# Altium schematic sheet CON_PCIe_X4.SchDoc
size 297 x 209 mm
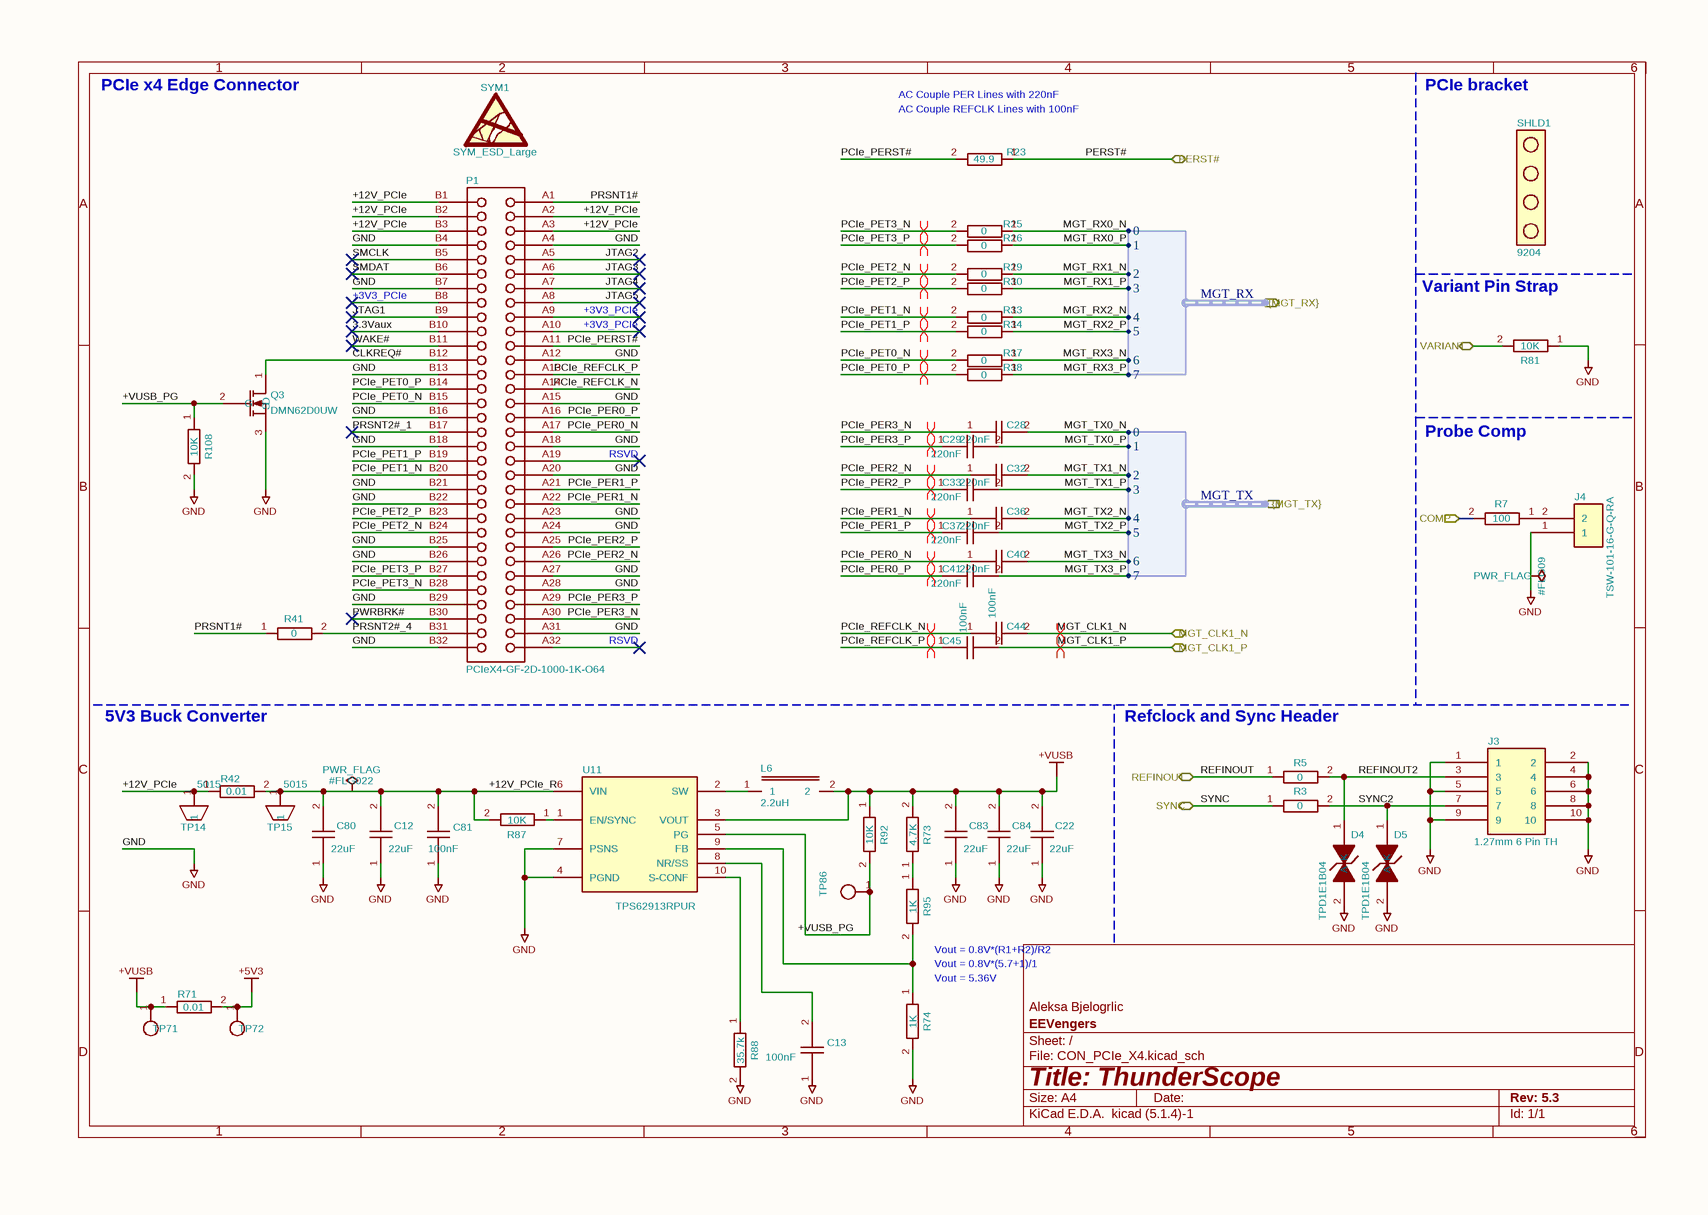
[diagram p0: CON_PCIe_X4.SchDoc]

## Parts
#FLG09  PWR_FLAG  (graphical)
#FLG022  PWR_FLAG  (graphical)
C12  22uF  [GEN_C_0805]
C13  100nF  [GEN_C_0402]
C22  22uF  [GEN_C_0805]
C28  220nF  [GEN_C_0402]
C29  220nF  [GEN_C_0402]
C32  220nF  [GEN_C_0402]
C33  220nF  [GEN_C_0402]
C36  220nF  [GEN_C_0402]
C37  220nF  [GEN_C_0402]
C40  220nF  [GEN_C_0402]
C41  220nF  [GEN_C_0402]
C44  100nF  [GEN_C_0402]
C45  100nF  [GEN_C_0402]
C80  22uF  [GEN_C_0805]
C81  100nF  [GEN_C_0402]
C83  22uF  [GEN_C_0805]
C84  22uF  [GEN_C_0805]
D4  TPD1E1B04  [TI_X1SON_DPY0002A]
D5  TPD1E1B04  [TI_X1SON_DPY0002A]
J3  1.27mm 6 Pin TH  [GEN_1.27mm_2x5_Pin_TH_RA]
J4  TSW-101-16-G-Q-RA  [GEN_5.08mm_1x2_Pin_TH_RA]
L6  2.2uH  [GEN_L_1210]
P1  PCIeX4-GF-2D-1000-1K-O64  [PCIeX4-GF-2D-1000-1K-O64]
Q3  DMN62D0UW  [GEN_SOT_323]
R3  0  [GEN_R_0402]
R5  0  [GEN_R_0402]
R7  100  [GEN_R_0402]
R23  49.9  [GEN_R_0402]
R25  0  [GEN_R_0402]
R26  0  [GEN_R_0402]
R29  0  [GEN_R_0402]
R30  0  [GEN_R_0402]
R33  0  [GEN_R_0402]
R34  0  [GEN_R_0402]
R37  0  [GEN_R_0402]
R38  0  [GEN_R_0402]
R41  0  [GEN_R_0402]
R42  0.01  [GEN_R_0603]
R71  0.01  [GEN_R_0603]
R73  4.7K  [GEN_R_0402]
R74  1K  [GEN_R_0402]
R81  10K  [GEN_R_0402]
R87  10K  [GEN_R_0402]
R88  35.7k  [GEN_R_0402]
R92  10K  [GEN_R_0402]
R95  1K  [GEN_R_0402]
R108  10K  [GEN_R_0402]
SHLD1  9204  (mechanical)
SYM1  SYM_ESD_Large  [ESD-Logo_6.6x6mm_SilkScreen]
TP14  5015  [KEY_5015]
TP15  5015  [KEY_5015]
TP71  PCB  [GEN_TP_PCB]  (value not drawn)
TP72  PCB  [GEN_TP_PCB]  (value not drawn)
TP86  PCB  [GEN_TP_PCB]  (value not drawn)
U11  value TPS62913RPUR  [TPS62913RPUR]  (hidden comment: TPS62913)

## Ports
COMP (in), MGT_CLK1_N (bidir), MGT_CLK1_P (bidir), PERST# (bidir), REFINOUT (bidir), SYNC (bidir), VARIANT (bidir), {MGT_RX} (out, harness MGT_RX), {MGT_TX} (in, harness MGT_TX)

## Harnesses
MGT_RX: 0, 1, 2, 3, 4, 5, 6, 7
MGT_TX: 0, 1, 2, 3, 4, 5, 6, 7

## Nets
+5V3: R71.2 TP72.1
+VUSB: C22.2 C83.2 C84.2 L6.2 R71.1 R73.2 R92.1 TP71.1 U11.3(VOUT)
GND: #FLG09.1 C12.1 C13.1 C22.1 C80.1 C81.1 C83.1 C84.1 D4.2(A) D5.2(A) J3.1 J3.2 J3.4 J3.5 J3.6 J3.8 J3.9 J3.10 J4.1 P1.A4 P1.A12 P1.A15 P1.A18 P1.A20 P1.A23 P1.A24 P1.A27 P1.A28 P1.A31 P1.B4 P1.B7 P1.B13 P1.B16 P1.B18 P1.B21 P1.B22 P1.B25 P1.B26 P1.B29 P1.B32 Q3.3(S) R74.2 R81.1 R88.2 R108.2 U11.4(PGND) U11.7(PSNS)
3.3Vaux: P1.B10
+12V_PCIe: P1.A2 P1.A3 P1.B1 P1.B2 P1.B3 R42.1 TP14.1
+12V_PCIe_R: #FLG022.1 C12.2 C80.2 C81.2 R42.2 R87.2 TP15.1 U11.6(VIN)
+VUSB_PG: Q3.2(G) R92.2 R108.1 TP86.1 U11.5(PG)
CLKREQ#: P1.B12 Q3.1(D)
COMP: R7.2 ; port COMP
JTAG1: P1.B9
JTAG2: P1.A5
JTAG3: P1.A6
JTAG4: P1.A7
JTAG5: P1.A8
MGT_CLK1_N: C44.2 ; port MGT_CLK1_N
MGT_CLK1_P: C45.2 ; port MGT_CLK1_P
MGT_RX0_N: R25.1 ; port {MGT_RX}.0
MGT_RX0_P: R26.1 ; port {MGT_RX}.1
MGT_RX1_N: R29.1 ; port {MGT_RX}.2
MGT_RX1_P: R30.1 ; port {MGT_RX}.3
MGT_RX2_N: R33.1 ; port {MGT_RX}.4
MGT_RX2_P: R34.1 ; port {MGT_RX}.5
MGT_RX3_N: R37.1 ; port {MGT_RX}.6
MGT_RX3_P: R38.1 ; port {MGT_RX}.7
MGT_TX0_N: C28.2 ; port {MGT_TX}.0
MGT_TX0_P: C29.2 ; port {MGT_TX}.1
MGT_TX1_N: C32.2 ; port {MGT_TX}.2
MGT_TX1_P: C33.2 ; port {MGT_TX}.3
MGT_TX2_N: C36.2 ; port {MGT_TX}.4
MGT_TX2_P: C37.2 ; port {MGT_TX}.5
MGT_TX3_N: C40.2 ; port {MGT_TX}.6
MGT_TX3_P: C41.2 ; port {MGT_TX}.7
PCIe_PER0_N: C40.1 P1.A17
PCIe_PER0_P: C41.1 P1.A16
PCIe_PER1_N: C36.1 P1.A22
PCIe_PER1_P: C37.1 P1.A21
PCIe_PER2_N: C32.1 P1.A26
PCIe_PER2_P: C33.1 P1.A25
PCIe_PER3_N: C28.1 P1.A30
PCIe_PER3_P: C29.1 P1.A29
PCIe_PERST#: P1.A11 R23.2
PCIe_PET0_N: P1.B15 R37.2
PCIe_PET0_P: P1.B14 R38.2
PCIe_PET1_N: P1.B20 R33.2
PCIe_PET1_P: P1.B19 R34.2
PCIe_PET2_N: P1.B24 R29.2
PCIe_PET2_P: P1.B23 R30.2
PCIe_PET3_N: P1.B28 R25.2
PCIe_PET3_P: P1.B27 R26.2
PCIe_REFCLK_N: C44.1 P1.A14
PCIe_REFCLK_P: C45.1 P1.A13
PERST#: R23.1 ; port PERST#
PRSNT1#: P1.A1 R41.1
PRSNT2#_1: P1.B17
PRSNT2#_4: P1.B31 R41.2
PWRBRK#: P1.B30
REFINOUT: R5.1 ; port REFINOUT
REFINOUT2: D4.1(K) J3.3 R5.2
SMCLK: P1.B5
SMDAT: P1.B6
SYNC: R3.1 ; port SYNC
SYNC2: D5.1(K) J3.7 R3.2
VARIANT: R81.2 ; port VARIANT
WAKE#: P1.B11
NetC13_2: C13.2 U11.8(NR/SS)
NetJ4_2: J4.2 R7.1
NetL6_1: L6.1 U11.2(SW)
NetR73_1: R73.1 R95.1
NetR74_1: R74.1 R95.2 U11.9(FB)
NetR87_1: R87.1 U11.1(EN/SYNC)
NetR88_1: R88.1 U11.10(S-CONF)

Not connected (* = marked no-connect by the designer): P1 A9* A10* A19* A32* B8*

## Layout directives
differential pair; differential pair class PCIe: PCIe_PER0_N, PCIe_PER0_P, PCIe_PER1_N, PCIe_PER1_P, PCIe_PER2_N, PCIe_PER2_P, PCIe_PER3_N, PCIe_PER3_P, PCIe_PET0_N, PCIe_PET0_P, PCIe_PET1_N, PCIe_PET1_P, PCIe_PET2_N, PCIe_PET2_P, PCIe_PET3_N, PCIe_PET3_P, PCIe_REFCLK_N, PCIe_REFCLK_P
differential pair: MGT_CLK1_N, MGT_CLK1_P

## Notes on the sheet
- PCIe x4 Edge Connector
- AC Couple PER Lines with 220nF
- (near R23) AC Couple REFCLK Lines with 100nF
- PCIe bracket
- +3V3_PCIe
- (near R81) Variant Pin Strap
- RSVD
- Probe Comp
- 5V3 Buck Converter
- Refclock and Sync Header
- Vout = 0.8V*(5.7+1)/1
- (near R95) Vout = 0.8V*(R1+R2)/R2
- (near R74) Vout = 5.36V
- 1
- 2
- 3
- 4
- 5
- 6
- A
- B
- C
- Aleksa Bjelogrlic
- D
- Title: ThunderScope
- File: CON_PCIe_X4.kicad_sch
- Sheet: /
- EEVengers
- KiCad E.D.A.  kicad (5.1.4)-1
- Size: A4
- Date:
- Rev: 5.3
- Id: 1/1

## Library data of the parts
C12 C22 C80 C83 C84 = CAP 22uF 25V X5R 0805: HOUSE PART NUMBER: C-22uF-0805-002; MANUFACTURER: Murata; MANUFACTURER PART NUMBER: GRM21BR61E226ME44L; VOLTAGE RATING: 25V; Substitutions Policy: Any Parametric Equivalent; PACKAGE: 0805; SUPPLIER 1: Mouser; SUPPLIER PART NUMBER 1: 81-GRM21BR61E226ME4L; Footprint: Thunderscope_Rev5:GEN_C_0805; Value: 22uF
C13 C44 C45 C81 = CAP 100nF 16V X7R 0402: HOUSE PART NUMBER: C-100nF-0402-002; MANUFACTURER: Murata; MANUFACTURER PART NUMBER: GCM155R71C104KA55D; VOLTAGE RATING: 16V; Substitutions Policy: Any Parametric Equivalent; PACKAGE: 0402; SUPPLIER 1: Mouser; SUPPLIER PART NUMBER 1: 81-GCM155R71C104KA5D; Footprint: Thunderscope_Rev5:GEN_C_0402; Value: 100nF
C28 C29 C32 C33 C36 C37 C40 C41 = CAP 220nF 16V X7R 0402: HOUSE PART NUMBER: C-100nF-0402-002; MANUFACTURER: Murata; MANUFACTURER PART NUMBER: GCM155R71C224KE02D; VOLTAGE RATING: 16V; Substitutions Policy: Any Parametric Equivalent; PACKAGE: 0402; SUPPLIER 1: Mouser; SUPPLIER PART NUMBER 1: 81-GCM155R71C224KE2D; Footprint: Thunderscope_Rev5:GEN_C_0402; Value: 220nF
D4 D5 = TVS TPD1E1B04: MANUFACTURER: Texas Instruments; MANUFACTURER PART NUMBER: TPD1E1B04DPYR; Substitutions Policy: No Substitutions; SUPPLIER 1: Texas Instruments; SUPPLIER PART NUMBER 1: TPD1E1B04DPYR; PACKAGE: 2-X1SON (1x0.6mm); Footprint: Thunderscope_Rev5:TI_X1SON_DPY0002A; Value: TPD1E1B04
J3 = CONN 1.27mm 2x5 Pin TH RA: MANUFACTURER: CNC Tech; MANUFACTURER PART NUMBER: 3220-10-0200-00; Substitutions Policy: ECO Required for Substitution; SUPPLIER 1: Digi-Key; SUPPLIER PART NUMBER 1: 1175-1628-ND; PACKAGE: Through Hole; Footprint: Thunderscope_Rev5:GEN_1.27mm_2x5_Pin_TH_RA; Value: 1.27mm 6 Pin TH
J4 = CONN 5.08mm 2 Pin TH RA: MANUFACTURER: Samtec; Substitutions Policy: ECO Required for Substitution; SUPPLIER 1: Mouser; SUPPLIER PART NUMBER 1: 200-TSW10116GQRA; MANUFACTURER PART NUMBER: TSW-101-16-G-Q-RA; PACKAGE: Through Hole; Value: TSW-101-16-G-Q-RA; Footprint: Thunderscope_Rev5:GEN_5.08mm_1x2_Pin_TH_RA
L6 = IND 1uH 5.5A 32 MOHM 1210: DFE322520FD-2R2M=P2; HOUSE PART NUMBER: SRP3212-1R0M; MANUFACTURER: Bourns; Substitutions Policy: ECO Required for Substitution; SUPPLIER 1: Mouser; SUPPLIER PART NUMBER 1: 652-SRP3212-1R0M; MANUFACTURER PART NUMBER: SRP3212-1R0M; PACKAGE: 1210; Value: 2.2uH; Footprint: Thunderscope_Rev5:GEN_L_1210
P1 = PCIeX4-GF-2D-1000-1K-O64: MATING CONNECTOR: Molex-87715-9106; DATASHEET VERSION: rev2.0, Apr-2007; PACKAGE REFERENCE: PCIeX4-GF-2D-1000-1K-O64; CLASSNAME: Edge Connector; PUBLISHER: Altium; COMPONENT KIND: Standard (No BOM); Footprint: Thunderscope_Rev5:PCIeX4-GF-2D-1000-1K-O64; Value: PCIeX4-GF-2D-1000-1K-O64
Q3 = NMOS DMN62D0UW: HOUSE PART NUMBER: DMN62D0UW-7; MANUFACTURER: Diodes; VDSS: 60V; Substitutions Policy: ECO Required for Substitution; SUPPLIER 1: Mouser; SUPPLIER PART NUMBER 1: 621-DMN62D0UW-7; MANUFACTURER PART NUMBER: DMN62D0UW-7; PACKAGE: SOT-323; Value: DMN62D0UW; Footprint: Thunderscope_Rev5:GEN_SOT_323
R3 R5 R25 R26 R29 R30 R33 R34 R37 R38 R41 = RES 0 OHM 1/16W 0402: MANUFACTURER: Yageo; MANUFACTURER PART NUMBER: RC0402JR-070RL; Substitutions Policy: Any Parametric Equivalent; PACKAGE: 0402; SUPPLIER 1: Mouser; SUPPLIER PART NUMBER 1: 603-RC0402JR-070RL; Footprint: Thunderscope_Rev5:GEN_R_0402; Value: 0
R7 = RES 100 OHM 1% 1/10W 0402: MANUFACTURER: Yageo; MANUFACTURER PART NUMBER: RC0402FR-07100RL; TOLERANCE: 1%; Substitutions Policy: Any Parametric Equivalent; PACKAGE: 0402; SUPPLIER 1: Mouser; SUPPLIER PART NUMBER 1: 603-RC0402FR-07100RL; Footprint: Thunderscope_Rev5:GEN_R_0402; Value: 100
R23 = RES 49.9 OHM 1% 1/10W 0402: MANUFACTURER: Yageo; MANUFACTURER PART NUMBER: RC0402FR-0749R9L; TOLERANCE: 1%; Substitutions Policy: Any Parametric Equivalent; PACKAGE: 0402; SUPPLIER 1: Mouser; SUPPLIER PART NUMBER 1: 603-RC0402FR-0749R9L; Footprint: Thunderscope_Rev5:GEN_R_0402; Value: 49.9
R42 R71 = RES 0.01 OHM 1% 1/4W 0603: HOUSE PART NUMBER: R-0.01-0603-1%-001; MANUFACTURER: Susumu; MANUFACTURER PART NUMBER: RL0816T-R010-F; TOLERANCE: 1%; Substitutions Policy: Any Parametric Equivalent; SUPPLIER 1: Mouser; SUPPLIER PART NUMBER 1: 754-RL0816T-R010-F; PACKAGE: 0603; Footprint: Thunderscope_Rev5:GEN_R_0603; Value: 0.01
R73 = RES 4.7K OHM 1% 1/16W 0402: MANUFACTURER: Yageo; MANUFACTURER PART NUMBER: RC0402FR-074K7L; TOLERANCE: 1%; Substitutions Policy: Any Parametric Equivalent; PACKAGE: 0402; SUPPLIER 1: Mouser; SUPPLIER PART NUMBER 1: 603-RC0402FR-074K7L; Footprint: Thunderscope_Rev5:GEN_R_0402; Value: 4.7K
R74 R95 = RES 1K OHM 1% 1/10W 0402: HOUSE PART NUMBER: R-1K-0402-1%-001; MANUFACTURER: Yageo; MANUFACTURER PART NUMBER: RC0402FR-071KL; TOLERANCE: 1%; Substitutions Policy: Any Parametric Equivalent; PACKAGE: 0402; SUPPLIER 1: Mouser; SUPPLIER PART NUMBER 1: 603-RC0402FR-071KL; Footprint: Thunderscope_Rev5:GEN_R_0402; Value: 1K
R81 R87 R92 R108 = RES 10K OHM 1% 1/16W 0402: MANUFACTURER: Yageo; MANUFACTURER PART NUMBER: RC0402FR-0710KL; TOLERANCE: 1%; Substitutions Policy: Any Parametric Equivalent; PACKAGE: 0402; SUPPLIER 1: Mouser; SUPPLIER PART NUMBER 1: 603-RC0402FR-0710KL; Footprint: Thunderscope_Rev5:GEN_R_0402; Value: 10K
R88 = RES 35.7K OHM 1% 1/16W 0402: MANUFACTURER: Yageo; MANUFACTURER PART NUMBER: RC0402FR-0735K7L; TOLERANCE: 1%; Substitutions Policy: Any Parametric Equivalent; PACKAGE: 0402; SUPPLIER 1: Mouser; SUPPLIER PART NUMBER 1: 603-RC0402FR-0735K7L; Footprint: Thunderscope_Rev5:GEN_R_0402; Value: 35.7k
SHLD1 = PCIe IO Shield: MANUFACTURER: Keystone Electronics; SUPPLIER 1: Mouser; SUPPLIER PART NUMBER 1: 534-9204; MANUFACTURER PART NUMBER: 9204; Value: 9204
TP14 TP15 = TP KEYSTONE 5015: MANUFACTURER: Keystone Electronics; SUPPLIER 1: Mouser; SUPPLIER PART NUMBER 1: 534-5015; MANUFACTURER PART NUMBER: 5015; Footprint: Thunderscope_Rev5:KEY_5015; Value: 5015
TP71 TP72 TP86 = TP PCB 1mm: Footprint: Thunderscope_Rev5:GEN_TP_PCB; Value: PCB
U11 = IC BUCK MODULE TPS62913: MANUFACTURER: Texas Instruments; MANUFACTURER PART NUMBER: TPSM82913RDUR; Substitutions Policy: No Substitutions; SUPPLIER 1: Texas Instruments; SUPPLIER PART NUMBER 1: TPSM82913RDUR; PACKAGE: 28-B0QFN (4.5x5.5mm); Footprint: Thunderscope_Rev5:TI_B0QFN_RDU0028A
#FLG09 #FLG022 = PWR_FLAG: Value: PWR_FLAG
SYM1 = SYM_ESD_Large: Value: SYM_ESD_Large; Footprint: Symbol:ESD-Logo_6.6x6mm_SilkScreen